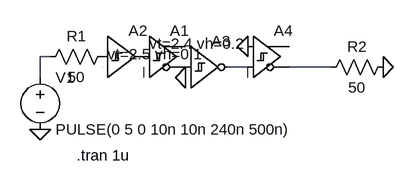
[diagram p0: schematic test_ltspice_schmitt.asc]
test_ltspice_schmitt.asc, the LTspice schematic file:
Version 4.1
SHEET 1 880 680
WIRE 80 96 64 96
WIRE 384 112 352 112
WIRE 512 112 448 112
WIRE 64 128 64 96
FLAG 64 208 0
FLAG 592 112 0
FLAG 288 128 0
FLAG 384 80 0
SYMBOL voltage 64 112 R0
WINDOW 123 0 0 Left 0
WINDOW 39 0 0 Left 0
SYMATTR InstName V1
SYMATTR Value PULSE(0 5 0 10n 10n 240n 500n)
SYMBOL Digital\\schmitt 224 32 R0
WINDOW 3 8 44 Left 2
SYMATTR InstName A1
SYMATTR Value vt=2.4 vh=0.2
SYMBOL Digital\\schmtbuf 160 32 R0
WINDOW 3 8 60 Left 2
SYMATTR InstName A2
SYMATTR Value vt=2.5 vh=0.1
SYMBOL Digital\\schmtinv 288 48 R0
SYMATTR InstName A3
SYMBOL res 176 80 R90
WINDOW 0 0 56 VBottom 2
WINDOW 3 32 56 VTop 2
SYMATTR InstName R1
SYMATTR Value 50
SYMBOL res 608 96 R90
WINDOW 0 0 56 VBottom 2
WINDOW 3 32 56 VTop 2
SYMATTR InstName R2
SYMATTR Value 50
SYMBOL Digital\\diffschmitt 384 32 R0
SYMATTR InstName A4
TEXT 120 248 Left 2 !.tran 1u

The netlist it stands for:
* test_ltspice_schmitt.asc
V1 N001 0 PULSE(0 5 0 10n 10n 240n 500n)
A1 P001 0 0 0 0 P002 0 0 SCHMITT vt=2.4 vh=0.2
A2 P003 0 0 0 0 0 P001 0 SCHMITT vt=2.5 vh=0.1
A3 P002 0 0 0 0 N002 0 0 SCHMITT
R1 P003 N001 50
R2 0 N003 50
A4 0 N002 0 0 0 N003 0 0 SCHMITT
.tran 1u
.backanno
.end